# Altium schematic sheet CH32M007E8U_FAN_R0.SchDoc
size C
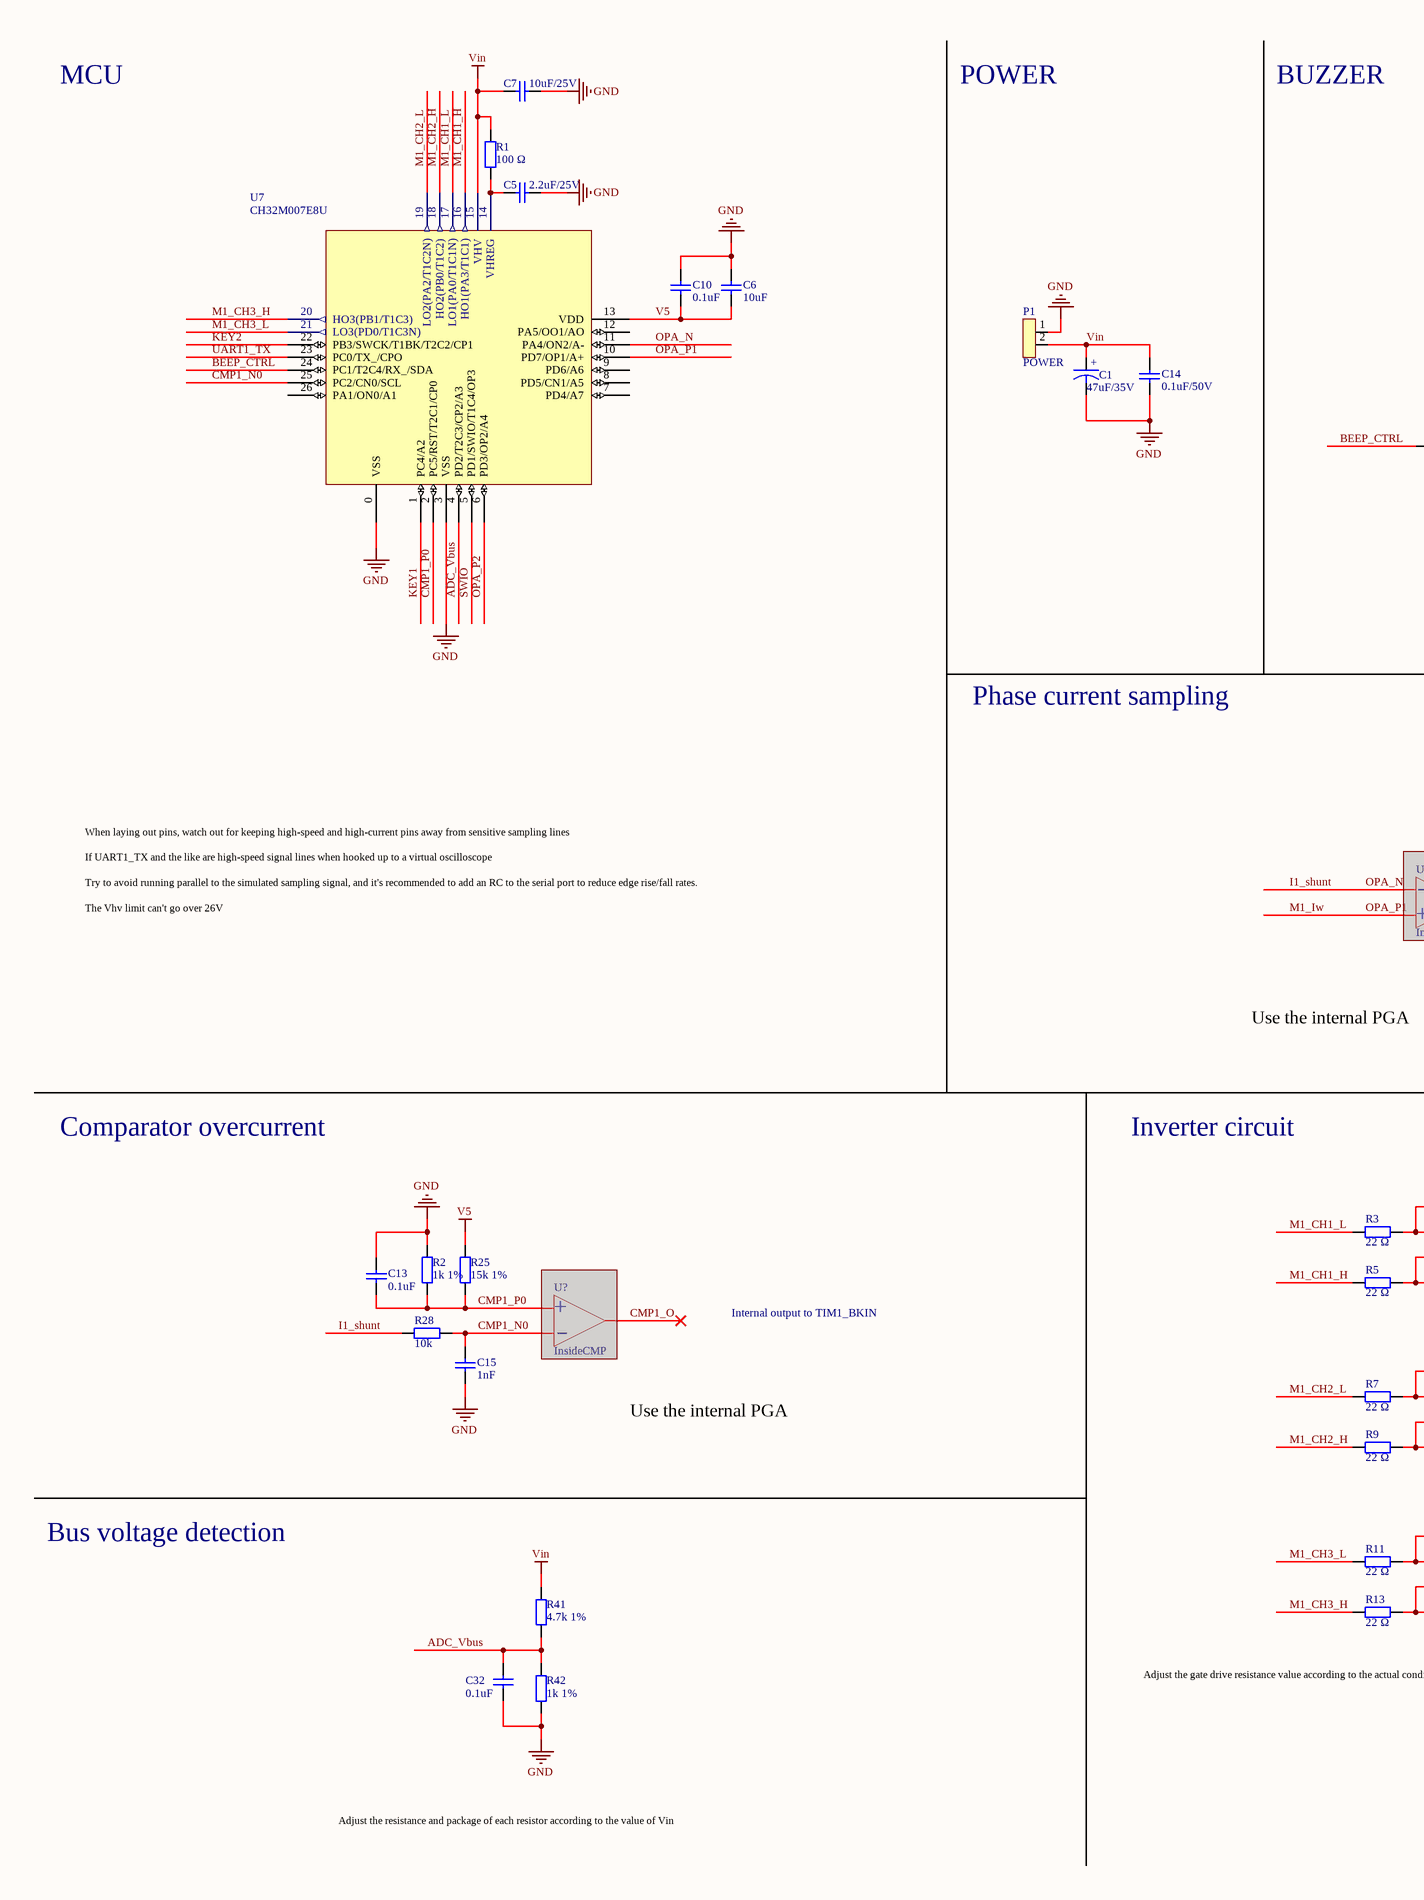
[diagram p0: CH32M007E8U_FAN_R0.SchDoc, left]
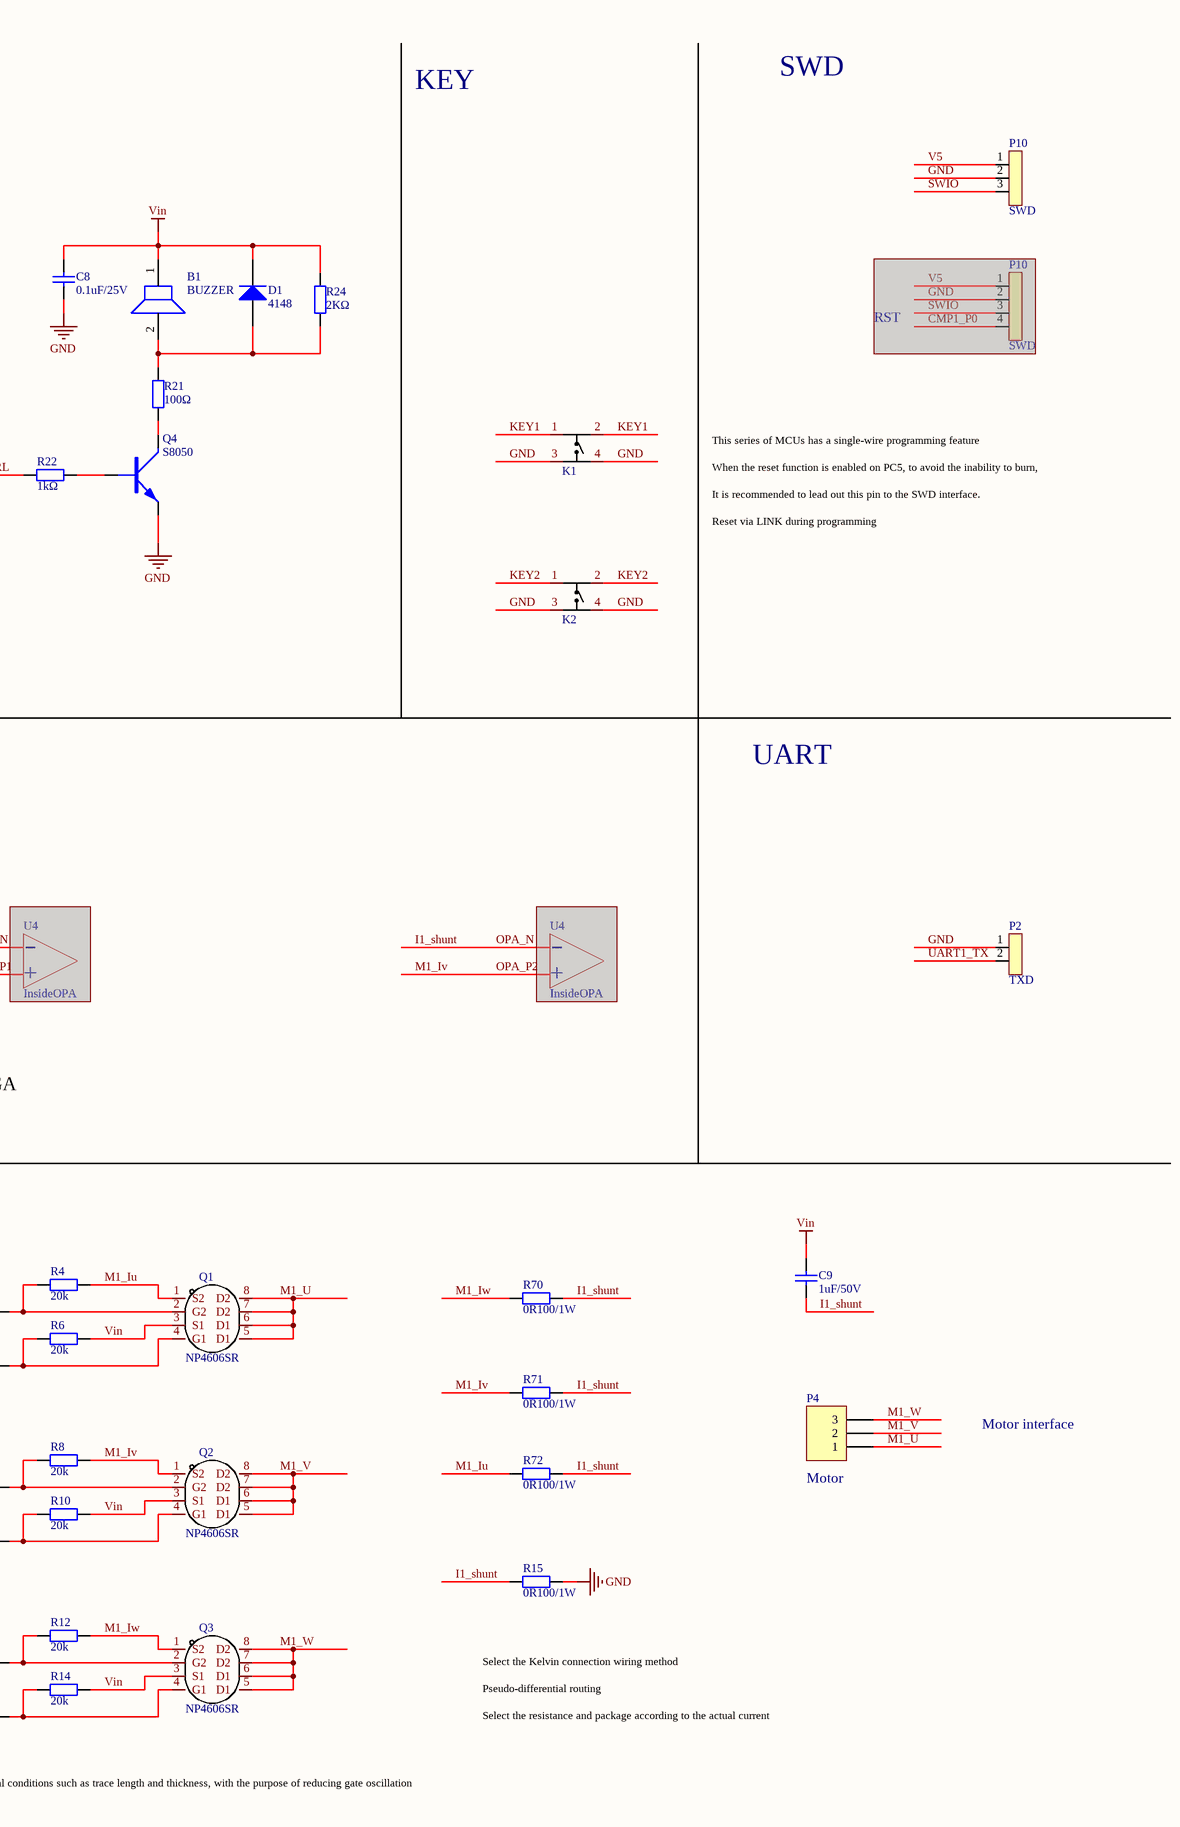
[diagram p1: CH32M007E8U_FAN_R0.SchDoc, right]

## Parts
(Parts that share a designator on the sheet are numbered #1, #2 ... from top to bottom, then left to right.)
B1  BUZZER  [M_BUZZER12550]
C1  47uF/35V  [M_C_RB_D5F2]
C5  2.2uF/25V  [M_C0603]
C6  10uF  [M_C0603]
C7  10uF/25V  [M_C0805]
C8  0.1uF/25V  [M_C0402-]
C9  1uF/50V  [M_C0805]
C10  0.1uF  [M_C0402-]
C13  0.1uF  [M_C0402-]
C14  0.1uF/50V  [M_C0402-]
C15  1nF  [M_C0402-]
C32  0.1uF  [M_C0402-]
D1  4148  [SOD-323]
K1  KH-6X6X8H-STM  [KEY2-SMD]  (value not drawn)
K2  KH-6X6X8H-STM  [KEY2-SMD]  (value not drawn)
P1  POWER  [WJ15EDGRC3.81-2]
P2  TXD  [HDR2.54-LI-2P]
P4  MHDR1X3  [WJ15EDGRC3.81-3]  (value not drawn)
P10#1  SWD  [HDR2.54-LI-3P]
P10#2  SWD  [HDR2.54-LI-4P]  (masked out: inside a compile mask, not in the netlist)
Q1  NP4606SR  [SOP8]
Q2  NP4606SR  [SOP8]
Q3  NP4606SR  [SOP8]
Q4  S8050  [SOT23]
R1  100 Ω  [M_R0805-]
R2  1k 1%  [M_R0402-]
R3  22 Ω  [M_R0402-]
R4  20k  [M_R0402-]
R5  22 Ω  [M_R0402-]
R6  20k  [M_R0402-]
R7  22 Ω  [M_R0402-]
R8  20k  [M_R0402-]
R9  22 Ω  [M_R0402-]
R10  20k  [M_R0402-]
R11  22 Ω  [M_R0402-]
R12  20k  [M_R0402-]
R13  22 Ω  [M_R0402-]
R14  20k  [M_R0402-]
R15  0R100/1W  [M_R1206-]
R21  100Ω  [M_R0603]
R22  1kΩ  [M_R0603]
R24  2KΩ  [M_R0805]
R25  15k 1%  [M_R0402-]
R28  10k  [M_R0402-]
R41  4.7k 1%  [M_R0603]
R42  1k 1%  [M_R0402-]
R70  0R100/1W  [M_R1206-]
R71  0R100/1W  [M_R1206-]
R72  0R100/1W  [M_R1206-]
U4#1  InsideOPA  (masked out: inside a compile mask, not in the netlist)
U4#2  InsideOPA  (masked out: inside a compile mask, not in the netlist)
U7  CH32M007E8U  [QFN26C_3X3]
U?  InsideCMP  (masked out: inside a compile mask, not in the netlist)

## Nets
GND: C1.2 C5.2 C6.2 C7.2 C8.2 C10.2 C13.2 C14.2 C15.1 C32.2 K1.3(C) K1.4(D) K2.3(C) K2.4(D) P1.1 P2.1 P10#1.2 Q4.2(E) R2.1 R15.1 R42.1 U7.0(VSS) U7.3(VSS)
V5: C6.1 C10.1 P10#1.1 R25.2 U7.13(VDD)
Vin: B1.1 C1.1 C7.1 C8.1 C9.1 C14.1 D1.2(K) P1.2 Q1.3(S1) Q2.3(S1) Q3.3(S1) R1.2 R6.1 R10.1 R14.1 R24.2 R41.2 U7.15(VHV)
ADC_Vbus: C32.1 R41.1 R42.2 U7.4(PD2/T2C3/CP2/A3)
BEEP_CTRL: R22.2 U7.24(PC1/T2C4/RX_/SDA)
CMP1_N0: C15.2 R28.2 U7.25(PC2/CN0/SCL)
CMP1_P0: C13.1 R2.2 R25.1 U7.2(PC5/RST/T2C1/CP0)
I1_shunt: C9.2 R15.2 R28.1 R70.1 R71.1 R72.1 U7.11(PA4/ON2/A-)  [also labelled OPA_N]
KEY1: K1.1(A) K1.2(B) U7.1(PC4/A2)
KEY2: K2.1(A) K2.2(B) U7.22(PB3/SWCK/T1BK/T2C2/CP1)
M1_CH1_H: R5.2 U7.16(HO1(PA3/T1C1))
M1_CH1_L: R3.2 U7.17(LO1(PA0/T1C1N))
M1_CH2_H: R9.2 U7.18(HO2(PB0/T1C2))
M1_CH2_L: R7.2 U7.19(LO2(PA2/T1C2N))
M1_CH3_H: R13.2 U7.20(HO3(PB1/T1C3))
M1_CH3_L: R11.2 U7.21(LO3(PD0/T1C3N))
M1_Iu: Q1.1(S2) R4.1 R72.2
M1_Iv: Q2.1(S2) R8.1 R71.2 U7.6(PD3/OP2/A4)  [also labelled OPA_P2]
M1_Iw: Q3.1(S2) R12.1 R70.2 U7.10(PD7/OP1/A+)  [also labelled OPA_P1]
M1_U: P4.1 Q1.5(D1) Q1.6(D1) Q1.7(D2) Q1.8(D2)
M1_V: P4.2 Q2.5(D1) Q2.6(D1) Q2.7(D2) Q2.8(D2)
M1_W: P4.3 Q3.5(D1) Q3.6(D1) Q3.7(D2) Q3.8(D2)
SWIO: P10#1.3 U7.5(PD1/SWIO/T1C4/OP3)
UART1_TX: P2.2 U7.23(PC0/TX_/CPO)
NetB1_2: B1.2 D1.1(A) R21.2 R24.1
NetC5_1: C5.1 R1.1 U7.14(VHREG)
NetQ1_2: Q1.2(G2) R3.1 R4.2
NetQ1_4: Q1.4(G1) R5.1 R6.2
NetQ2_2: Q2.2(G2) R7.1 R8.2
NetQ2_4: Q2.4(G1) R9.1 R10.2
NetQ3_2: Q3.2(G2) R11.1 R12.2
NetQ3_4: Q3.4(G1) R13.1 R14.2
NetQ4_1: Q4.1(B) R22.1
NetQ4_3: Q4.3(C) R21.1

Not connected (* = marked no-connect by the designer): U7 7(PD4/A7) 8(PD5/CN1/A5) 9(PD6/A6) 12(PA5/OO1/AO) 26(PA1/ON0/A1)

## Notes on the sheet
- MCU
- POWER
- BUZZER
- KEY
- SWD
- RST
- This series of MCUs has a single-wire programming feature
- When the reset function is enabled on PC5, to avoid the inability to burn,
- It is recommended to lead out this pin to the SWD interface.
- Reset via LINK during programming
- Phase current sampling
- UART
- When laying out pins, watch out for keeping high-speed and high-current pins away from sensitive sampling lines
- If UART1_TX and the like are high-speed signal lines when hooked up to a virtual oscilloscope
- Try to avoid running parallel to the simulated sampling signal, and it's recommended to add an RC to the serial port to reduce edge rise/fall rates.
- The Vhv limit can't go over 26V
- Use the internal PGA
- Comparator overcurrent
- Inverter circuit
- Internal output to TIM1_BKIN
- Motor interface
- (near P4) Motor
- Bus voltage detection
- Select the Kelvin connection wiring method
- Pseudo-differential routing
- Adjust the gate drive resistance value according to the actual conditions such as trace length and thickness, with the purpose of reducing gate oscillation
- Select the resistance and package according to the actual current
- Adjust the resistance and package of each resistor according to the value of Vin
- (in symbol CAPACITOR POL_2) +
- (in symbol InsideOPA) +
- (in symbol InsideOPA2) +

## Library data of the parts
C1 = CAPACITOR POL_2: Capacitor; Value: 47uF/35V
C5-C10 C13-C15 C32 = Cap Semi: Capacitor (Semiconductor SIM Model); Published: 8-Jun-2000; LatestRevisionDate: 17-Jul-2002; LatestRevisionNote: Re-released for DXP Platform.; PackageReference: C0805; Publisher: Altium Limited
  C5: Value: 2.2uF/25V
  C6: Value: 10uF
  C7: Value: 10uF/25V
  C8: Value: 0.1uF/25V
  C9: Value: 1uF/50V
  C10 C13 C32: Value: 0.1uF
  C14: Value: 0.1uF/50V
  C15: Value: 1nF
D1 = Diode 1N4148: High Conductance Fast Diode; Published: 8-Jun-2000; LatestRevisionDate: 17-Jul-2002; LatestRevisionNote: Re-released for DXP Platform.; DatasheetDocument: 1997; PackageReference: DO-35; Publisher: Altium Limited; Code_JEDEC: DO-204-AH; ComponentLink1Description: Manufacturer Link; ComponentLink1URL: http://www.fairchildsemi.com/; ComponentLink2Description: Datasheet; ComponentLink2URL: http://www.fairchildsemi.com/ds/1N%2F1N4148.pdf
K1 K2 = KH-6X6X8H-STM: Add into BOM: yes; Contact Current: 50mA; Voltage Rating (DC): 12V; Mechanical Life: 80000; Switch Length: 6mm; Name: KH-6X6X8H-STM; Symbol: KH-6X6X8H-STM; Device: KH-6X6X8H-STM; LCSC Part Name: KH-6X6X8H-STM; Supplier Part: C2837534; Manufacturer Part: KH-6X6X8H-STM; Supplier Footprint: SMD; JLCPCB Part Class: Extended Part; Datasheet: https://atta.szlcsc.com/upload/public/pdf/source/20210608/C2837534_94EAC7D8AFBB996E2814FACF50FEEF85.pdf; Supplier: LCSC; Convert to PCB: yes; Voltage Rating (AC): -; Power Rating: -; With Lamp: -; Operating Force: -; Operating Temperature: -; IP Rating: -; Switch Width: 6mm; Switch Height: -
P1 P2 = 2PIN
P4 = MHDR1X3: Header, 3-Pin; LatestRevisionDate: 17-Jul-2002; LatestRevisionNote: Re-released for DXP Platform.; Publisher: Altium Limited
P10#1 = 3PIN
P10#2 = 4PIN
Q1-Q3 = NP9926BSR-G: Add into BOM: yes; Drain Source Voltage (Vdss): 20V; Continuous Drain Current (Id): 6A; Power Dissipation (Pd): 1.25W; Gate Threshold Voltage (Vgs(th)@Id): 700mV@250uA; Total Gate Charge (Qg@Vgs): 12nC@4.5V; Input Capacitance (Ciss@Vds): 900pF@10V; Reverse Transfer Capacitance (Crss@Vds): 100pF@10V; Symbol: NP9926BSR-G; Device: NP9926BSR-G; Supplier Part: C2991134; Manufacturer Part: NP9926BSR-G; Supplier Footprint: SOP-8; JLCPCB Part Class: Extended Part; Datasheet: https://atta.szlcsc.com/upload/public/pdf/source/20220426/45EDAE8AA532D945771DBC41E7CE2370.pdf; Supplier: LCSC; Convert to PCB: yes
Q4 = NPN1
R1-R15 R21 R22 R24 R25 R28 R41 R42 R70-R72 = Res2: Resistor; Published: 8-Jun-2000; LatestRevisionDate: 17-Jul-2002; LatestRevisionNote: Re-released for DXP Platform.; PackageReference: AXIAL-0.4; Publisher: Altium Limited
  R1: Value: 100 Ω
  R2 R42: Value: 1k 1%
  R3 R5 R7 R9 R11 R13: Value: 22 Ω
  R4 R6 R8 R10 R12 R14: Value: 20k
  R15 R70-R72: Value: 0R100/1W
  R21: Value: 100Ω
  R22: Value: 1kΩ
  R24: Value: 2KΩ
  R25: Value: 15k 1%
  R28: Value: 10k
  R41: Value: 4.7k 1%
U7 = CH32M007E8U: RISC-V MCU, 48MHz, OPA/CMP/UART/I2C, 24V P/NMOS gate driver for motor
U? = InsideOPA2